# Altium schematic sheet USB.SchDoc
size A4; SheetNumber: 3; SheetTotal: 9
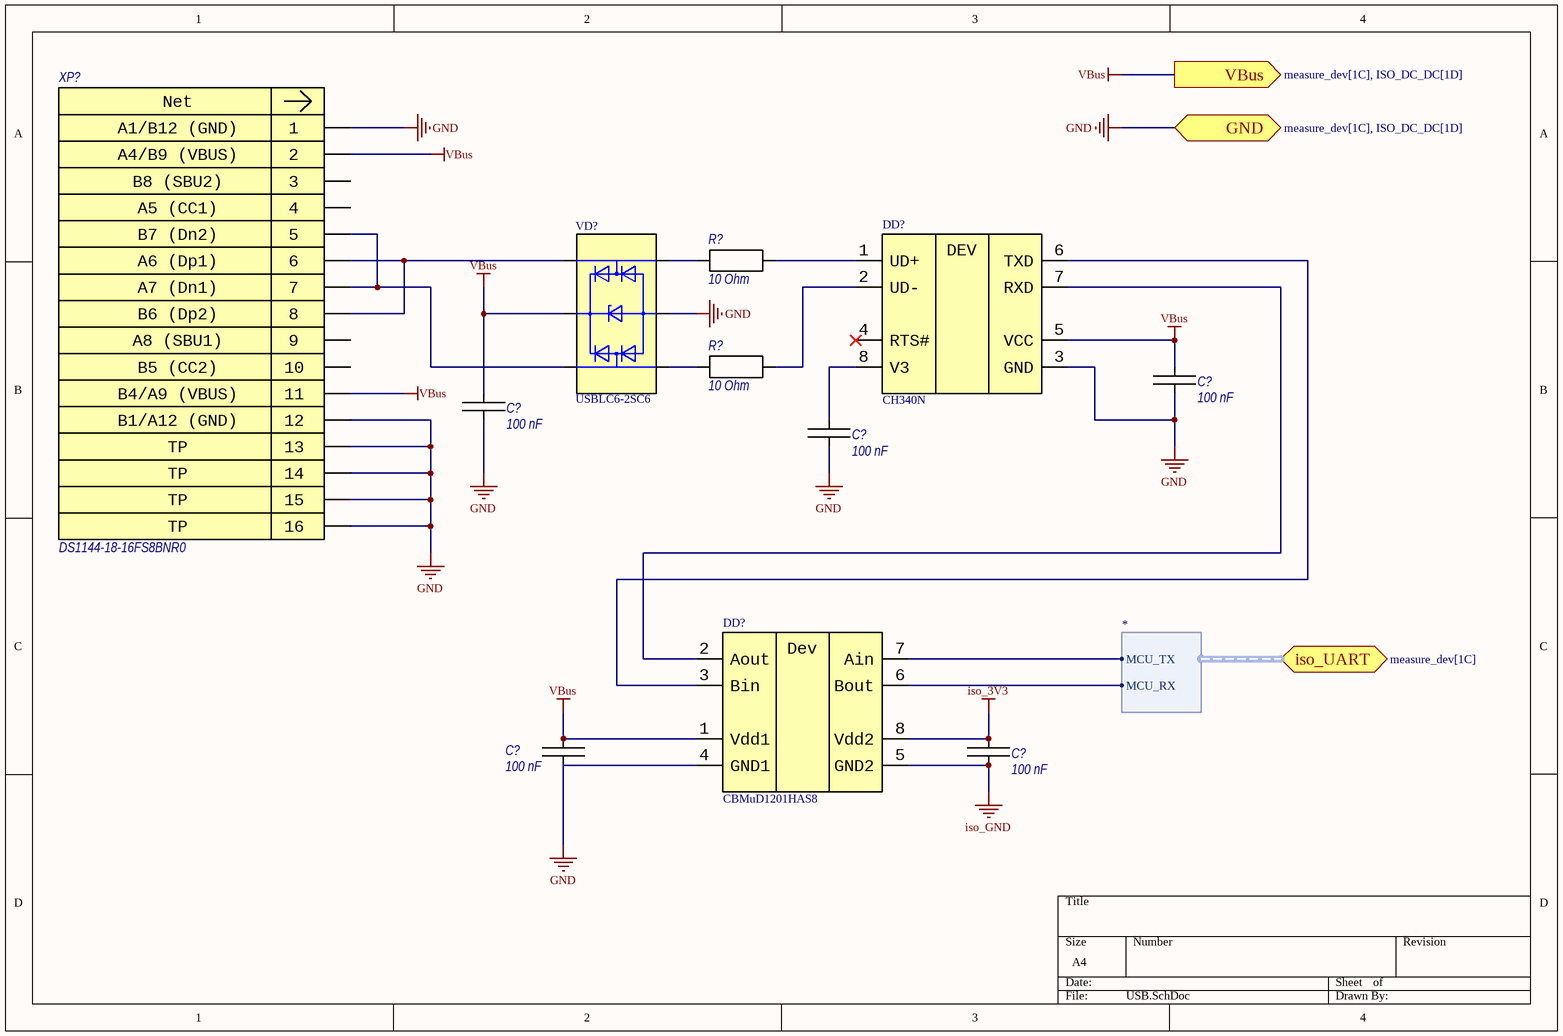
[diagram p0: USB.SchDoc]

## Parts
(Parts that share a designator on the sheet are numbered #1, #2 ... from top to bottom, then left to right.)
C?#1  100 nF  [0603C]
C?#2  100 nF  [0603C]
C?#3  100 nF  [0603C]
C?#4  100 nF  [0603C]
C?#5  100 nF  [0603C]
DD?#1  CH340N  [SO-8]
DD?#2  CBMuD1201HAS8  [SO-8]
R?#1  10 Ohm  [0603R]
R?#2  10 Ohm  [0603R]
VD?  USBLC6-2SC6  [SOT-23-6]
XP?  DS1144-18-16FS8BNR0  [USB-C_16P]

## Ports
GND (bidir, see measure_dev[1C], ISO_DC_DC[1D]), iso_UART (bidir, harness *, see measure_dev[1C]), VBus (out, see measure_dev[1C], ISO_DC_DC[1D])

## Harnesses
*: MCU_TX, MCU_RX

## Nets
GND: C?#1.2 C?#2.2 C?#3.2 C?#4.2 DD?#1.3(GND) DD?#2.4(GND1) VD?.2 XP?.1 XP?.12 XP?.13 XP?.14 XP?.15 XP?.16 ; port GND
iso_3V3: C?#5.1 DD?#2.8(Vdd2)
iso_GND: C?#5.2 DD?#2.5(GND2)
VBus: C?#1.1 C?#2.1 C?#4.1 DD?#1.5(VCC) DD?#2.1(Vdd1) VD?.5 XP?.2 XP?.11 ; port VBus
NetC?#3_1: C?#3.1 DD?#1.8(V3)
NetDD?#1_1: DD?#1.1(UD+) R?#1.1
NetDD?#1_2: DD?#1.2(UD-) R?#2.1
NetDD?#1_6: DD?#1.6(TXD) DD?#2.3(Bin)
NetDD?#1_7: DD?#1.7(RXD) DD?#2.2(Aout)
NetDD?#2_6: DD?#2.6(Bout) ; port iso_UART.MCU_RX
NetDD?#2_7: DD?#2.7(Ain) ; port iso_UART.MCU_TX
NetR?#1_2: R?#1.2 VD?.3
NetR?#2_2: R?#2.2 VD?.1
NetVD?_4: VD?.4 XP?.6 XP?.8
NetVD?_6: VD?.6 XP?.5 XP?.7

Not connected (* = marked no-connect by the designer): DD?#1 4(RTS#)*; XP? 3 4 9 10

## Notes on the sheet
- (in symbol CBMuD1201HAS8) Dev
- (in symbol CH340N) DEV
- (in symbol DS1144-18-16FS8BNR0) Net; A1/B12 (GND); A4/B9 (VBUS); B8 (SBU2); A5 (CC1); B7 (Dn2); A6 (Dp1); A7 (Dn1); B6 (Dp2); A8 (SBU1); B5 (CC2); B4/A9 (VBUS); B1/A12 (GND); TP

## Library data of the parts
C?#1-C?#5 = CL10B104KB8NNN: Manufacturer: Samsung; Tolerance: 10%; Voltage: 50 V; Dielectric: X7R; Part Number: CL10B104KB8NNN; Package: 0603; Value: 100 nF
DD?#1 = CH340N: USB to serial port converter; Manufacturer: WCH; Part Number: CH340N; Package: SO-8; Datasheet: https://static.chipdip.ru/lib/375/DOC030375417.pdf
DD?#2 = CBMuD1201HAS8: Manufacturer: COREBAI; Number of Channels: 2; Part Number: CBMuD1201HAS8; Package: SO-8; Input Current: -; Input Reverse Voltage: -; Output Current: -; Output Power: -; Type: digital isolator 2 directions 2 ways; Datasheet: https://static.chipdip.ru/lib/815/DOC059815915.pdf
R?#1 R?#2 = RC0603FR-0710RL: Manufacturer: Yageo; Tolerance: 1%; Power: 0.100 Watt; Part Number: RC0603FR-0710RL; Package: 0603; Value: 10 Ohm
VD? = USBLC6-2SC6: Manufacturer: STMicroelectronics; Part Number: USBLC6-2SC6; Package: SOT-23-6; Datasheet: file:///D:/downloads/usblc6-2.pdf
XP? = DS1144-18-16FS8BNR0: Manufacturer: CONNFLY; Part Number: DS1144-18-16FS8BNR0; Imax: -; Umax: -; Mating Connector: -; Datasheet: https://doc.platan.ru/pdf/datasheets/connfly/DS1144-18.pdf